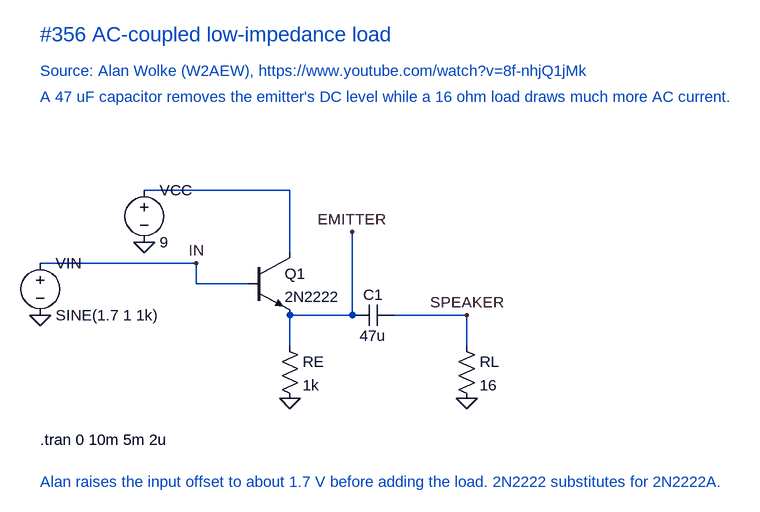
[diagram p0: schematic AC coupled speaker load.asc]
AC coupled speaker load.asc, the LTspice schematic file:
Version 4
SHEET 1 1136 800
WIRE 544 176 320 176
WIRE 544 272 544 176
WIRE 400 288 160 288
WIRE 400 320 400 288
WIRE 480 320 400 320
WIRE 608 368 544 368
WIRE 640 368 608 368
WIRE 640 240 640 368
WIRE 816 368 704 368
WIRE 816 416 816 368
WIRE 544 416 544 368
FLAG 320 256 0
FLAG 160 368 0
FLAG 544 496 0
FLAG 816 496 0
FLAG 400 288 IN
FLAG 816 368 SPEAKER
FLAG 640 240 EMITTER
SYMBOL voltage 320 160 R0
SYMATTR InstName VCC
SYMATTR Value 9
SYMBOL voltage 160 272 R0
SYMATTR InstName VIN
SYMATTR Value SINE(1.7 1 1k)
SYMBOL npn 480 272 R0
SYMATTR InstName Q1
SYMATTR Value 2N2222
SYMBOL res 528 400 R0
SYMATTR InstName RE
SYMATTR Value 1k
SYMBOL cap 704 352 R90
WINDOW 0 0 32 VBottom 2
WINDOW 3 32 32 VTop 2
SYMATTR InstName C1
SYMATTR Value 47u
SYMBOL res 800 400 R0
SYMATTR InstName RL
SYMATTR Value 16
TEXT 160 -64 Left 3 ;#356 AC-coupled low-impedance load
TEXT 160 -8 Left 2 ;Source: Alan Wolke (W2AEW), https://www.youtube.com/watch?v=8f-nhjQ1jMk
TEXT 160 32 Left 2 ;A 47 uF capacitor removes the emitter's DC level while a 16 ohm load draws much more AC current.
TEXT 160 624 Left 2 ;Alan raises the input offset to about 1.7 V before adding the load. 2N2222 substitutes for 2N2222A.
TEXT 160 560 Left 2 !.tran 0 10m 5m 2u

The netlist it stands for:
* AC coupled speaker load.asc
VCC N001 0 9
VIN IN 0 SINE(1.7 1 1k)
Q1 N001 IN EMITTER 0 2N2222
RE EMITTER 0 1k
C1 SPEAKER EMITTER 47u
RL SPEAKER 0 16
.model NPN NPN
.model PNP PNP
.lib standard.bjt
* #356 AC-coupled low-impedance load
* Source: Alan Wolke (W2AEW), https://www.youtube.com/watch?v=8f-nhjQ1jMk
* A 47 uF capacitor removes the emitter's DC level while a 16 ohm load draws much more AC current.
* Alan raises the input offset to about 1.7 V before adding the load. 2N2222 substitutes for 2N2222A.
.tran 0 10m 5m 2u
.backanno
.end